# Altium schematic sheet Sensors-Sheet.SchDoc (part 1 of 2)
size 420 x 297 mm; SheetNumber: 7; SheetTotal: 8
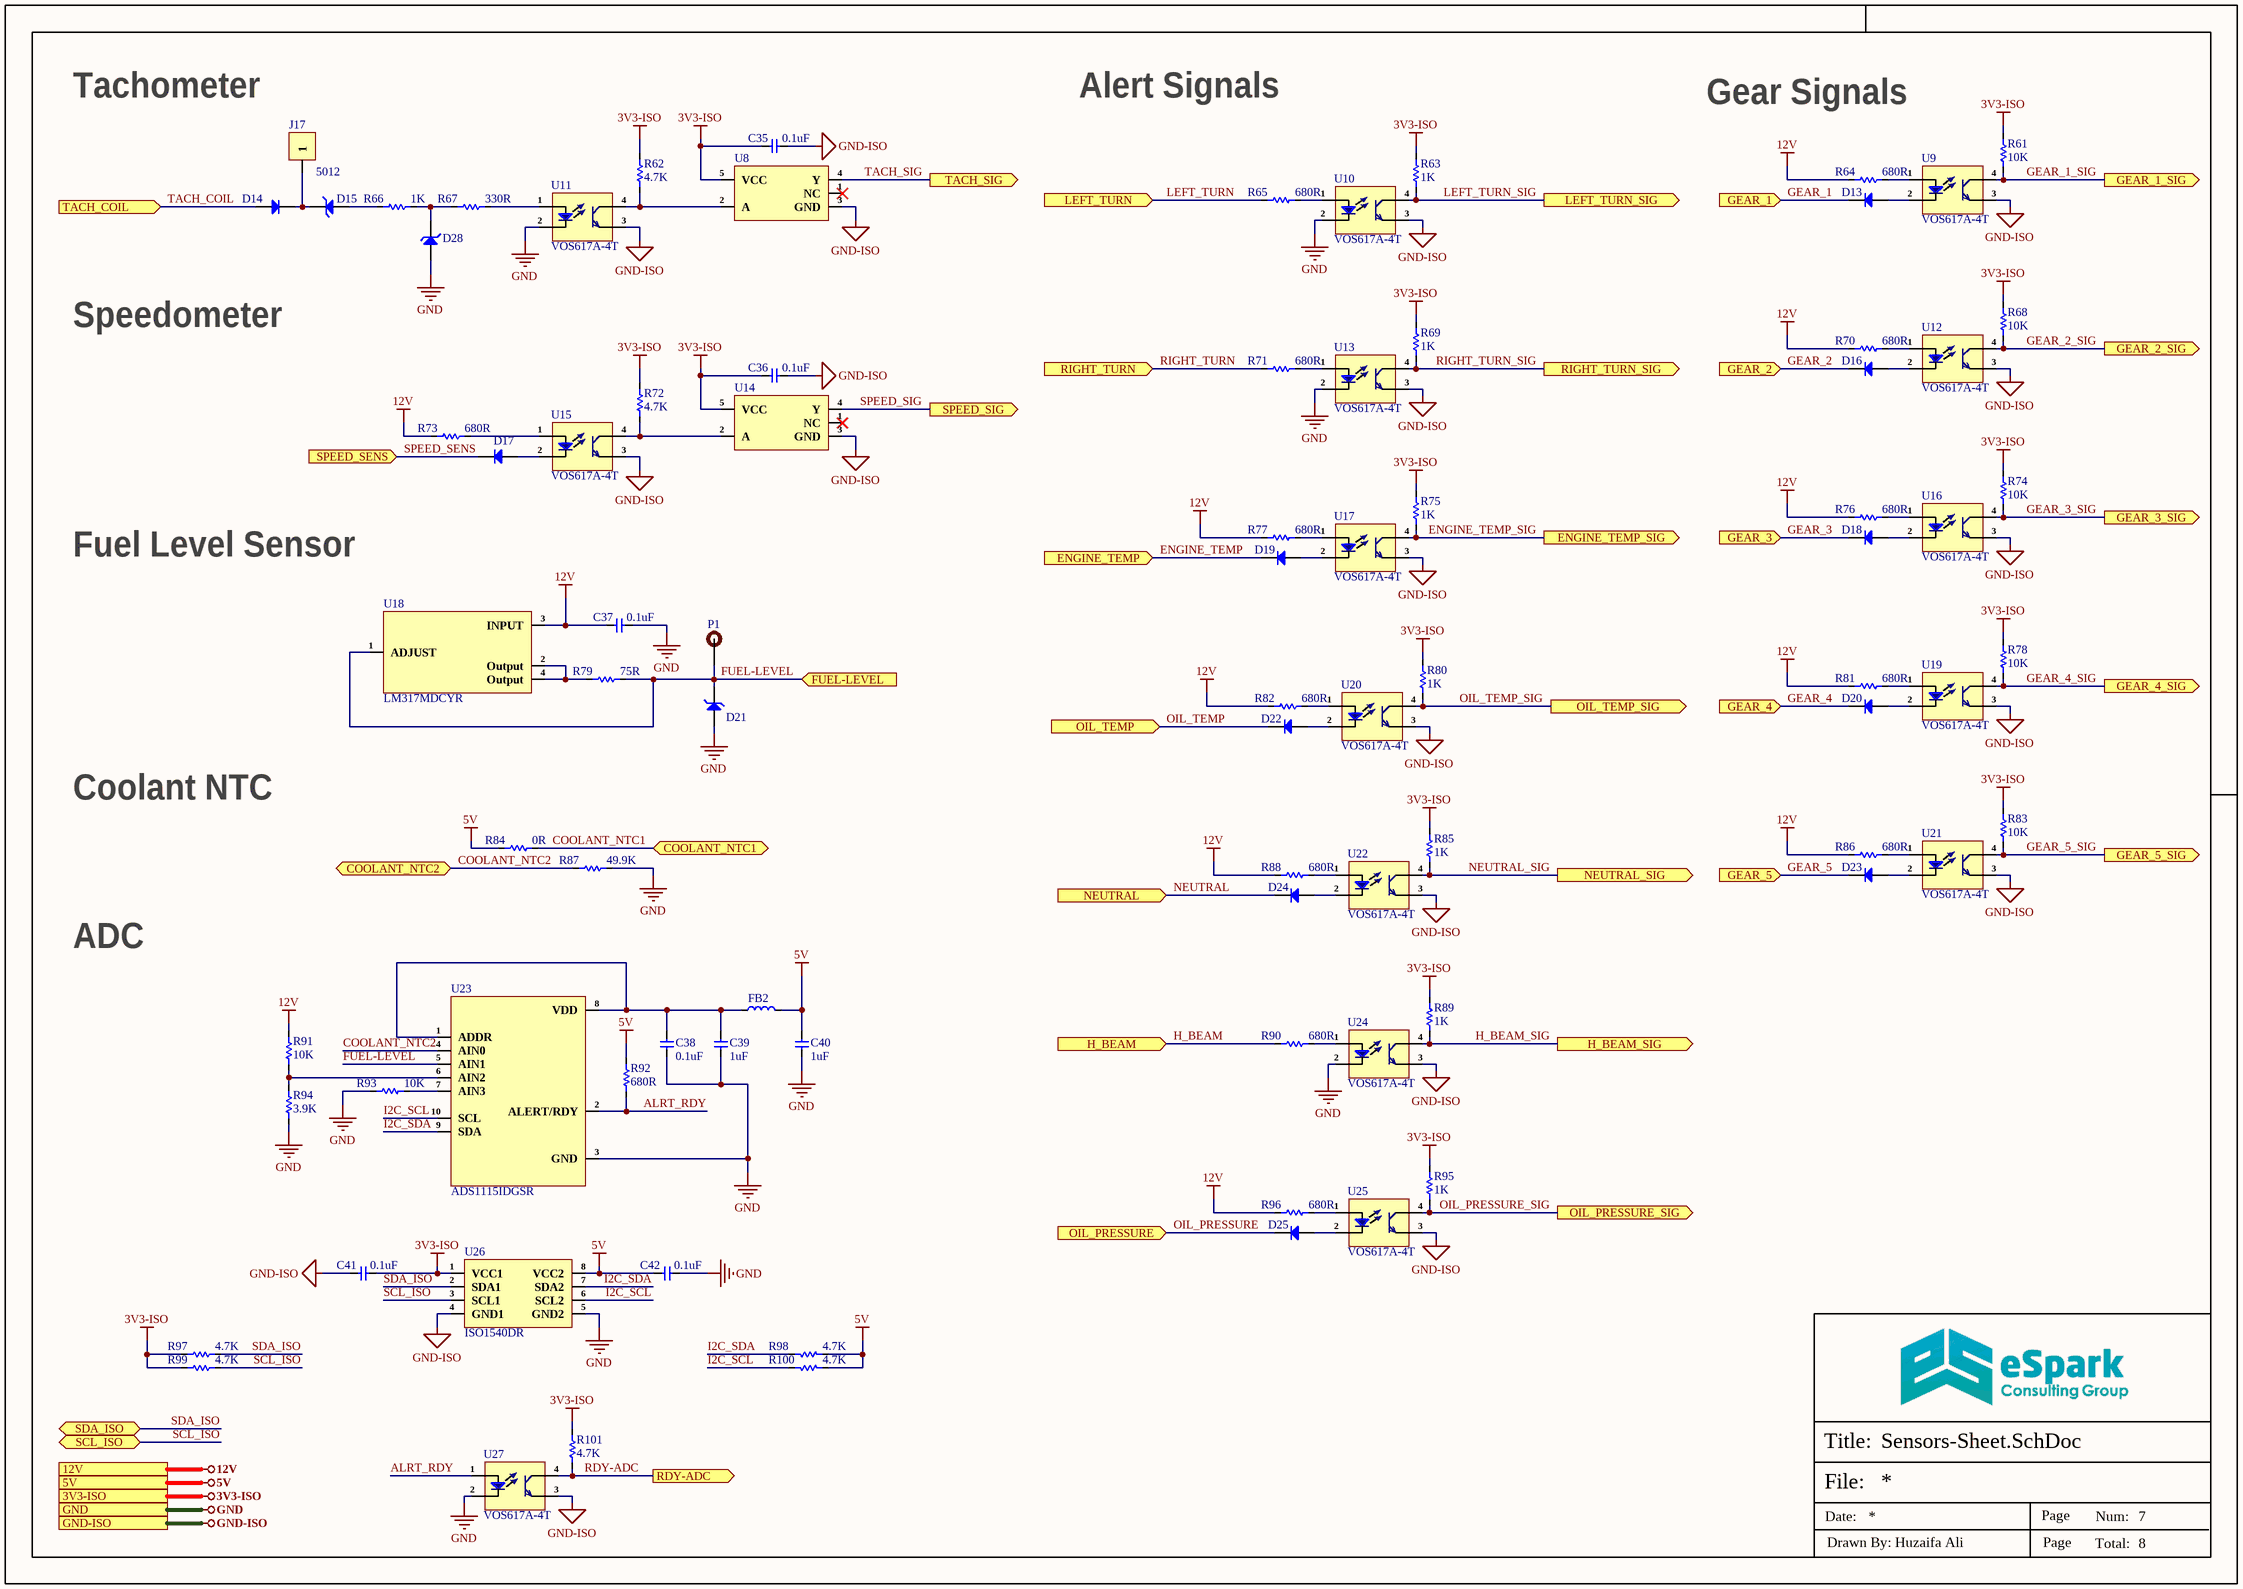
[diagram p0: Sensors-Sheet.SchDoc]

## Parts
C35  0.1uF  [Cap-0402]
C36  0.1uF  [Cap-0402]
C37  0.1uF  [Cap-0402]
C38  0.1uF  [Cap-0402]
C39  1uF  [Cap-0402]
C40  1uF  [Cap-0402]
C41  0.1uF  [Cap-0402]
C42  0.1uF  [Cap-0402]
D13  1N4148W  [SOD-123]  (value not drawn)
D14  ES1B  [SMA(DO-214AC)]  (value not drawn)
D15  1SMB5949BT3G  [SMB_]  (value not drawn)
D16  1N4148W  [SOD-123]  (value not drawn)
D17  1N4148W-7-F  [SOD-123]  (value not drawn)
D18  1N4148W  [SOD-123]  (value not drawn)
D19  1N4148W  [SOD-123]  (value not drawn)
D20  1N4148W  [SOD-123]  (value not drawn)
D21  MSP3V3HM3/89A  [MicroSMP]  (value not drawn)
D22  1N4148W  [SOD-123]  (value not drawn)
D23  1N4148W  [SOD-123]  (value not drawn)
D24  1N4148W  [SOD-123]  (value not drawn)
D25  1N4148W  [SOD-123]  (value not drawn)
D28  1SMA4755A  [SMA]  (value not drawn)
FB2  MMZ2012R102ATD25  [Ind-0805]  (value not drawn)
J17  5012  [5012]
P1  TEST POINT 0.5mm Dia  [Test-point - 0.5mm]  (value not drawn)  (no BOM)
R61  10K  [Res-0402]
R62  4.7K  [Res-0402]
R63  1K  [Res-0402]
R64  680R  [Res-0402]
R65  680R  [Res-0402]
R66  1K  [Res-1206]
R67  330R  [Res-1206]
R68  10K  [Res-0402]
R69  1K  [Res-0402]
R70  680R  [Res-0402]
R71  680R  [Res-0402]
R72  4.7K  [Res-0402]
R73  680R  [Res-0402]
R74  10K  [Res-0402]
R75  1K  [Res-0402]
R76  680R  [Res-0402]
R77  680R  [Res-0402]
R78  10K  [Res-0402]
R79  75R  [Res-0603]
R80  1K  [Res-0402]
R81  680R  [Res-0402]
R82  680R  [Res-0402]
R83  10K  [Res-0402]
R84  0R  [Res-0402]
R85  1K  [Res-0402]
R86  680R  [Res-0402]
R87  49.9K  [Res-0402]
R88  680R  [Res-0402]
R89  1K  [Res-0402]
R90  680R  [Res-0402]
R91  10K  [Res-0603]
R92  680R  [Res-0402]
R93  10K  [Res-0603]
R94  3.9K  [Res-0402]
R95  1K  [Res-0402]
R96  680R  [Res-0402]
R97  4.7K  [Res-0402]
R98  4.7K  [Res-0402]
R99  4.7K  [Res-0402]
R100  4.7K  [Res-0402]
R101  4.7K  [Res-0402]
U8  SN74AHC1G14DBVR  [SOT-23-5]  (value not drawn)
U9  VOS617A-4T  [SOIC-4-175mil]
U10  VOS617A-4T  [SOIC-4-175mil]
U11  VOS617A-4T  [SOIC-4-175mil]
U12  VOS617A-4T  [SOIC-4-175mil]
U13  VOS617A-4T  [SOIC-4-175mil]
U14  SN74AHC1G14DBVR  [SOT-23-5]  (value not drawn)
U15  VOS617A-4T  [SOIC-4-175mil]
U16  VOS617A-4T  [SOIC-4-175mil]
U17  VOS617A-4T  [SOIC-4-175mil]
U18  LM317MDCYR  [SOT- 223]
U19  VOS617A-4T  [SOIC-4-175mil]
U20  VOS617A-4T  [SOIC-4-175mil]
U21  VOS617A-4T  [SOIC-4-175mil]
U22  VOS617A-4T  [SOIC-4-175mil]
U23  ADS1115IDGSR  [VSSOP-10]
U24  VOS617A-4T  [SOIC-4-175mil]
U25  VOS617A-4T  [SOIC-4-175mil]
U26  ISO1540DR  [SOIC-8(0.154", 3.90mm Width)]
U27  VOS617A-4T  [SOIC-4-175mil]

## Ports
3V3-ISO (see Top-Sheet[2B], CAN-Sheet[4D], Controller-Sheet-1[4D], Controller-Sheet-2[4D], Power-Sheet[4D]), 5V (see Top-Sheet[2B], Power-Sheet[4D]), 12V (see Top-Sheet[2B], Power-Sheet[4D]), COOLANT_NTC1 (bidir, see Top-Sheet[2C]), COOLANT_NTC2 (bidir, see Top-Sheet[2C]), ENGINE_TEMP (in, see Top-Sheet[2C]), ENGINE_TEMP_SIG (out, see Top-Sheet[2B]), FUEL-LEVEL (in, see Top-Sheet[2C]), GEAR_1 (in, see Top-Sheet[2C]), GEAR_1_SIG (out, see Top-Sheet[2B]), GEAR_2 (in, see Top-Sheet[2C]), GEAR_2_SIG (out, see Top-Sheet[2B]), GEAR_3 (in, see Top-Sheet[2C]), GEAR_3_SIG (out, see Top-Sheet[2B]), GEAR_4 (in, see Top-Sheet[2C]), GEAR_4_SIG (out, see Top-Sheet[2B]), GEAR_5 (in, see Top-Sheet[2C]), GEAR_5_SIG (out, see Top-Sheet[2B]), GND (see Top-Sheet[2B], Connector-Sheet[4D], Power-Sheet[4D]), GND-ISO (see Top-Sheet[2B], CAN-Sheet[4D], Controller-Sheet-1[4D], Controller-Sheet-2[4D], Power-Sheet[4D], USB-Sheet[4D]), H_BEAM (in, see Top-Sheet[2C]), H_BEAM_SIG (out, see Top-Sheet[2B]), LEFT_TURN (in, see Top-Sheet[2C]), LEFT_TURN_SIG (out, see Top-Sheet[2B]), NEUTRAL (in, see Top-Sheet[2C]), NEUTRAL_SIG (out, see Top-Sheet[2B]), OIL_PRESSURE (in, see Top-Sheet[2C]), OIL_PRESSURE_SIG (out, see Top-Sheet[2B]), OIL_TEMP (in, see Top-Sheet[2C]), OIL_TEMP_SIG (out, see Top-Sheet[2B]), RDY-ADC (out, see Top-Sheet[2B]), RIGHT_TURN (in, see Top-Sheet[2C]), RIGHT_TURN_SIG (out, see Top-Sheet[2B]), SCL_ISO (bidir, see Top-Sheet[2B]), SDA_ISO (bidir, see Top-Sheet[2B]), SPEED_SENS (in, see Top-Sheet[2C]), SPEED_SIG (out, see Top-Sheet[2B]), TACH_COIL (in, see Top-Sheet[2C]), TACH_SIG (out, see Top-Sheet[2B])

## Nets
3V3-ISO: C35.1 C36.1 C41.1 R61.2 R62.2 R63.2 R68.2 R69.2 R72.2 R74.2 R75.2 R78.2 R80.2 R83.2 R85.2 R89.2 R95.2 R97.2 R99.2 R101.1 U8.5(VCC) U14.5(VCC) U26.1(VCC1) ; port 3V3-ISO
5V: C40.2 C42.2 FB2.2 R84.1 R92.2 R98.2 R100.2 U26.8(VCC2) ; port 5V
12V: C37.1 R64.1 R70.1 R73.1 R76.1 R77.1 R81.1 R82.1 R86.1 R88.1 R91.2 R96.1 U18.3(INPUT) ; port 12V
GND: C37.2 C38.1 C39.1 C40.1 C42.1 D21.1(A) D28.2(A) R87.2 R93.2 R94.1 U10.2(Ca) U11.2(Ca) U13.2(Ca) U23.3(GND) U24.2(Ca) U26.5(GND2) U27.2(Ca) ; port GND
GND-ISO: C35.2 C36.2 C41.2 U8.3(GND) U9.3(E) U10.3(E) U11.3(E) U12.3(E) U13.3(E) U14.3(GND) U15.3(E) U16.3(E) U17.3(E) U19.3(E) U20.3(E) U21.3(E) U22.3(E) U24.3(E) U25.3(E) U26.4(GND1) U27.3(E) ; port GND-ISO
ALRT_RDY: R92.1 U23.2(ALERT/RDY) U27.1(An)
COOLANT_NTC1: R84.2 ; port COOLANT_NTC1
COOLANT_NTC2: R87.1 U23.4(AIN0) ; port COOLANT_NTC2
ENGINE_TEMP: D19.2(K) ; port ENGINE_TEMP
ENGINE_TEMP_SIG: R75.1 U17.4(C) ; port ENGINE_TEMP_SIG
FUEL-LEVEL: D21.2(K) P1.1 R79.2 U18.1(ADJUST) U23.5(AIN1) ; port FUEL-LEVEL
GEAR_1: D13.2(K) ; port GEAR_1
GEAR_1_SIG: R61.1 U9.4(C) ; port GEAR_1_SIG
GEAR_2: D16.2(K) ; port GEAR_2
GEAR_2_SIG: R68.1 U12.4(C) ; port GEAR_2_SIG
GEAR_3: D18.2(K) ; port GEAR_3
GEAR_3_SIG: R74.1 U16.4(C) ; port GEAR_3_SIG
GEAR_4: D20.2(K) ; port GEAR_4
GEAR_4_SIG: R78.1 U19.4(C) ; port GEAR_4_SIG
GEAR_5: D23.2(K) ; port GEAR_5
GEAR_5_SIG: R83.1 U21.4(C) ; port GEAR_5_SIG
H_BEAM: R90.1 ; port H_BEAM
H_BEAM_SIG: R89.1 U24.4(C) ; port H_BEAM_SIG
I2C_SCL: R100.1 U23.10(SCL) U26.6(SCL2)
I2C_SDA: R98.1 U23.9(SDA) U26.7(SDA2)
LEFT_TURN: R65.1 ; port LEFT_TURN
LEFT_TURN_SIG: R63.1 U10.4(C) ; port LEFT_TURN_SIG
NEUTRAL: D24.2(K) ; port NEUTRAL
NEUTRAL_SIG: R85.1 U22.4(C) ; port NEUTRAL_SIG
OIL_PRESSURE: D25.2(K) ; port OIL_PRESSURE
OIL_PRESSURE_SIG: R95.1 U25.4(C) ; port OIL_PRESSURE_SIG
OIL_TEMP: D22.2(K) ; port OIL_TEMP
OIL_TEMP_SIG: R80.1 U20.4(C) ; port OIL_TEMP_SIG
RDY-ADC: R101.2 U27.4(C) ; port RDY-ADC
RIGHT_TURN: R71.1 ; port RIGHT_TURN
RIGHT_TURN_SIG: R69.1 U13.4(C) ; port RIGHT_TURN_SIG
SCL_ISO: R99.1 U26.3(SCL1) ; port SCL_ISO
SDA_ISO: R97.1 U26.2(SDA1) ; port SDA_ISO
SPEED_SENS: D17.2(K) ; port SPEED_SENS
SPEED_SIG: U14.4(Y) ; port SPEED_SIG
TACH_COIL: D14.2(A) ; port TACH_COIL
TACH_SIG: U8.4(Y) ; port TACH_SIG
NetC38_2: C38.2 C39.2 FB2.1 U23.1(ADDR) U23.8(VDD)
NetD13_1: D13.1(A) U9.2(Ca)
NetD14_1: D14.1(K) D15.2(K) J17.1
NetD15_1: D15.1(A) R66.1
NetD16_1: D16.1(A) U12.2(Ca)
NetD17_1: D17.1(A) U15.2(Ca)
NetD18_1: D18.1(A) U16.2(Ca)
NetD19_1: D19.1(A) U17.2(Ca)
NetD20_1: D20.1(A) U19.2(Ca)
NetD22_1: D22.1(A) U20.2(Ca)
NetD23_1: D23.1(A) U21.2(Ca)
NetD24_1: D24.1(A) U22.2(Ca)
NetD25_1: D25.1(A) U25.2(Ca)
NetD28_1: D28.1(K) R66.2 R67.1
NetR62_1: R62.1 U8.2(A) U11.4(C)
NetR64_2: R64.2 U9.1(An)
NetR65_2: R65.2 U10.1(An)
NetR67_2: R67.2 U11.1(An)
NetR70_2: R70.2 U12.1(An)
NetR71_2: R71.2 U13.1(An)
NetR72_1: R72.1 U14.2(A) U15.4(C)
NetR73_2: R73.2 U15.1(An)
NetR76_2: R76.2 U16.1(An)
NetR77_2: R77.2 U17.1(An)
NetR79_1: R79.1 U18.2(Output) U18.4(Output)
NetR81_2: R81.2 U19.1(An)
NetR82_2: R82.2 U20.1(An)
NetR86_2: R86.2 U21.1(An)
NetR88_2: R88.2 U22.1(An)
NetR90_2: R90.2 U24.1(An)
NetR91_1: R91.1 R94.2 U23.6(AIN2)
NetR93_1: R93.1 U23.7(AIN3)
NetR96_2: R96.2 U25.1(An)

Not connected (* = marked no-connect by the designer): U8 1(NC)*; U14 1(NC)*

## Notes on the sheet
- Tachometer
- Alert Signals
- Gear Signals
- Speedometer
- Fuel Level Sensor
- Coolant NTC
- ADC
- File:
- Title:
- Date:
- Page
- Num:
- Total:
- Drawn By: Huzaifa Ali